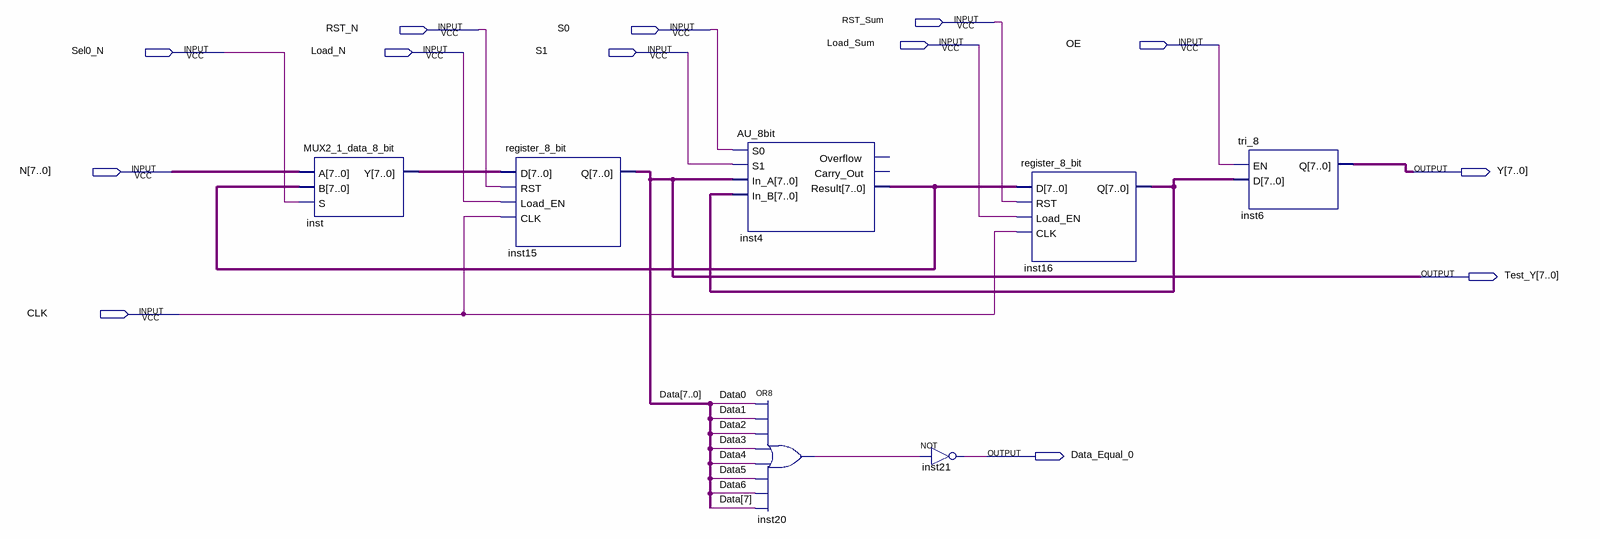
[diagram p0: schematic sheet]
// Quartus schematic datapath.bdf as structural Verilog: 7 symbols, 13 pins
module datapath (
  input  RST_Sum,
  input  RST_N,
  input  S0,
  input  Load_Sum,
  input  OE,
  input  Sel0_N,
  input  Load_N,
  input  S1,
  input  [7:0] N,
  input  CLK,
  output [7:0] Y,
  output [7:0] Test_Y,
  output Data_Equal_0
);

  wire inst20_out;
  wire [7:0] inst4_result, inst16_q, inst_y;

  MUX2_1_data_8_bit inst (.A(N), .B(inst4_result), .S(Sel0_N), .Y(inst_y));
  register_8_bit inst15 (.RST(RST_N), .Load_EN(Load_N), .D(inst_y), .CLK(CLK), .Q(Test_Y));
  AU_8bit inst4 (.S1(S1), .In_A(Test_Y), .S0(S0), .In_B(inst16_q), .Result(inst4_result));  // open: Overflow, Carry_Out
  or inst20 (inst20_out, Test_Y[0], Test_Y[1], Test_Y[2], Test_Y[3], Test_Y[4], Test_Y[5], Test_Y[6], Test_Y[7]);
  not inst21 (Data_Equal_0, inst20_out);
  register_8_bit inst16 (.RST(RST_Sum), .Load_EN(Load_Sum), .D(inst4_result), .CLK(CLK), .Q(inst16_q));
  tri_8 inst6 (.EN(OE), .D(inst16_q), .Q(Y));

  // Other names for the same wires on the sheet: Data[7:0] = Test_Y; Data0 = Test_Y[0]; Data1 = Test_Y[1];
  //   Data2 = Test_Y[2]; Data3 = Test_Y[3]; Data4 = Test_Y[4]; Data5 = Test_Y[5]; Data6 = Test_Y[6]
endmodule
